# Altium schematic sheet voltage_dividers.SchDoc
size A
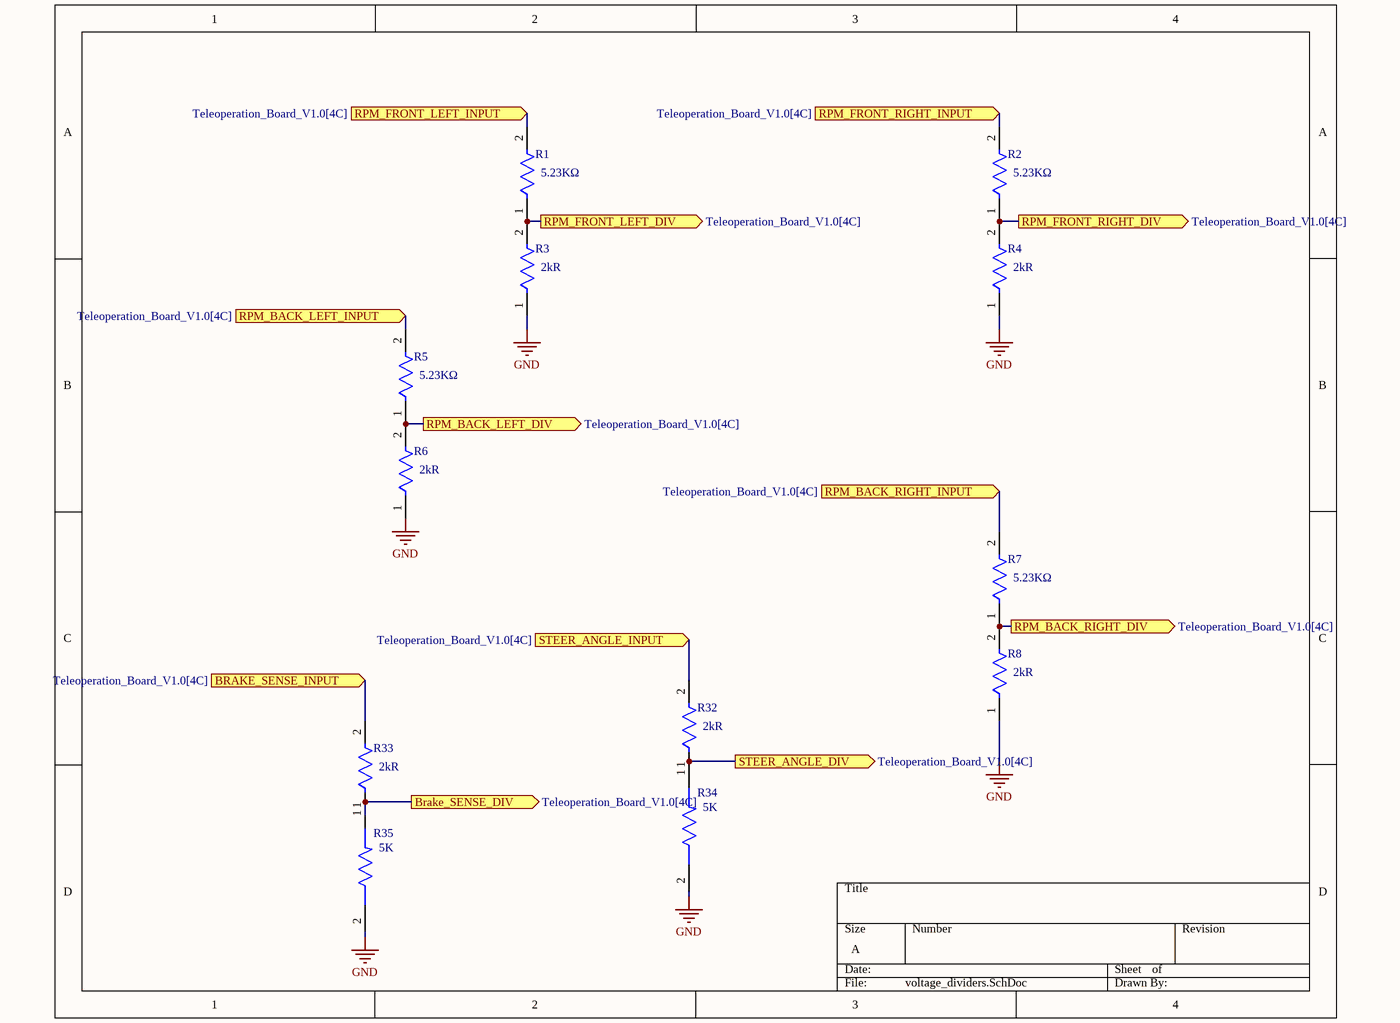
[diagram p0: voltage_dividers.SchDoc]

## Parts
R1  Resistance: 5.23KΩ  [FP-RT0603-MFG]  (hidden comment: RT0603BRD075K23L)
R2  Resistance: 5.23KΩ  [FP-RT0603-MFG]  (hidden comment: RT0603BRD075K23L)
R3  Resistance: 2kR  [FP-ERA3A-IPC_C]  (hidden comment: ERA3AEB202V)
R4  Resistance: 2kR  [FP-ERA3A-IPC_C]  (hidden comment: ERA3AEB202V)
R5  Resistance: 5.23KΩ  [FP-RT0603-MFG]  (hidden comment: RT0603BRD075K23L)
R6  Resistance: 2kR  [FP-ERA3A-IPC_C]  (hidden comment: ERA3AEB202V)
R7  Resistance: 5.23KΩ  [FP-RT0603-MFG]  (hidden comment: RT0603BRD075K23L)
R8  Resistance: 2kR  [FP-ERA3A-IPC_C]  (hidden comment: ERA3AEB202V)
R32  Resistance: 2kR  [FP-ERA3A-IPC_C]  (hidden comment: ERA3AEB202V)
R33  Resistance: 2kR  [FP-ERA3A-IPC_C]  (hidden comment: ERA3AEB202V)
R34  MCT06030D5001BP500  [RESC1608X55N]  (value not drawn)
R35  MCT06030D5001BP500  [RESC1608X55N]  (value not drawn)

## Ports
Brake_SENSE_DIV (out, see Teleoperation_Board_V1.0[4C]), BRAKE_SENSE_INPUT (in, see Teleoperation_Board_V1.0[4C]), RPM_BACK_LEFT_DIV (out, see Teleoperation_Board_V1.0[4C]), RPM_BACK_LEFT_INPUT (in, see Teleoperation_Board_V1.0[4C]), RPM_BACK_RIGHT_DIV (out, see Teleoperation_Board_V1.0[4C]), RPM_BACK_RIGHT_INPUT (in, see Teleoperation_Board_V1.0[4C]), RPM_FRONT_LEFT_DIV (out, see Teleoperation_Board_V1.0[4C]), RPM_FRONT_LEFT_INPUT (in, see Teleoperation_Board_V1.0[4C]), RPM_FRONT_RIGHT_DIV (out, see Teleoperation_Board_V1.0[4C]), RPM_FRONT_RIGHT_INPUT (in, see Teleoperation_Board_V1.0[4C]), STEER_ANGLE_DIV (out, see Teleoperation_Board_V1.0[4C]), STEER_ANGLE_INPUT (in, see Teleoperation_Board_V1.0[4C])

## Nets
GND: R3.1 R4.1 R6.1 R8.1 R34.2 R35.2
Brake_SENSE_DIV: R33.1 R35.1 ; port Brake_SENSE_DIV
BRAKE_SENSE_INPUT: R33.2 ; port BRAKE_SENSE_INPUT
RPM_BACK_LEFT_DIV: R5.1 R6.2 ; port RPM_BACK_LEFT_DIV
RPM_BACK_LEFT_INPUT: R5.2 ; port RPM_BACK_LEFT_INPUT
RPM_BACK_RIGHT_DIV: R7.1 R8.2 ; port RPM_BACK_RIGHT_DIV
RPM_BACK_RIGHT_INPUT: R7.2 ; port RPM_BACK_RIGHT_INPUT
RPM_FRONT_LEFT_DIV: R1.1 R3.2 ; port RPM_FRONT_LEFT_DIV
RPM_FRONT_LEFT_INPUT: R1.2 ; port RPM_FRONT_LEFT_INPUT
RPM_FRONT_RIGHT_DIV: R2.1 R4.2 ; port RPM_FRONT_RIGHT_DIV
RPM_FRONT_RIGHT_INPUT: R2.2 ; port RPM_FRONT_RIGHT_INPUT
STEER_ANGLE_DIV: R32.1 R34.1 ; port STEER_ANGLE_DIV
STEER_ANGLE_INPUT: R32.2 ; port STEER_ANGLE_INPUT

## Notes on the sheet
- (near R34) 5K
- (near R35) 5K

## Library data of the parts
R1 R2 R5 R7 = CMP-03412-031710-1: RES SMD 5.23K OHM 0.1% 1/10W; Manufacturer: Yageo; Tolerance: 0.001; Voltage Rating: 75V; Value: 5.23KΩ; Power Rating: 0.1W; Temperature Coefficient: 25 ppm/°C; Composition: Thin Film; Device Class L2: Resistors; Device Class L1: Passive Components; Mouser Description: Thin Film Resistors 1/10W 5.23K ohm .1% 25ppm; Package: RT0603; Automotive: No; Device Class L3: Chip SMD Resistors; ComponentLink2URL: http://www.yageo.com/documents/recent/PYu-RT_1-to-0.01_RoHS_L_9.pdf; Temperature: -55°C to +155°C; Manufacturer Part Number: RT0603BRD075K23L; Height: 0.55mm; Temperature Range High: +155°C; Lead Free: Yes; Series: RT; Ipc Land Pattern Name: RESC16080X45; Temperature Range Low: -55°C; ComponentLink2Description: Datasheet; Octopart: https://octopart.com/rt0603brd075k23l-yageo-1448416; RoHS: TRUE; Digikey Description: RES SMD 5.23K OHM 0.1% 1/10W; Footprint Url: http://www.yageo.com/exep/pages/download/literatures/PYu-R_Mount_10.pdf; Category: Res
R3 R4 R6 R8 R32 R33 = CMP-2000-00945-2: RES SMD 2K OHM 0.1% 1/10W 0603; Max Power Dissipation: 100mW; Voltage Rating (DC): 75V; Temperature Coefficient: 25ppm/°C; REACH SVHC: No SVHC; Number of Terminations: 2; RoHS Compliant: Yes; Case Code (Metric): 1608; Package Quantity: 5000; Width: 0.8mm; Mount: Surface Mount; Series: ERA-3A; Number of Pins: 2; Height: 0.45mm; Military Standard: Not; Packaging: Tape and Reel; Resistor Type: Thin Film; Lead Free: Lead Free; Construction: Rectangular; Max Operating Temperature: 155°C; Contact Plating: Tin; Termination: SMD/SMT; Technology: THIN FILM; Length: 1.6mm; Power Rating: 100mW; Resistance Tolerance: 0.1%; Working Voltage: 75V; Voltage Rating: 75V; Depth: 0.8mm; Case Code (Imperial): 0603; Radiation Hardening: No; Case/Package: 0603; Tolerance: 0.1%; Min Operating Temperature: -55°C
R34 R35 = MCT06030D5001BP500: Resistor; Manufacturer_Name: Vishay; Datasheet Link: http://www.vishay.com/docs/28705/mcx0x0xpro.pdf; Height: 0.55mm; Manufacturer_Part_Number: MCT06030D5001BP500; Arrow Part Number: MCT06030D5001BP500; Arrow Price/Stock: https://www.arrow.com/en/products/mct06030d5001bp500/vishay?utm_currency=USD&region=nac